# Altium schematic sheet [01] - COVER PAGE.SchDoc
size A; SheetNumber: 2; SheetTotal: 4
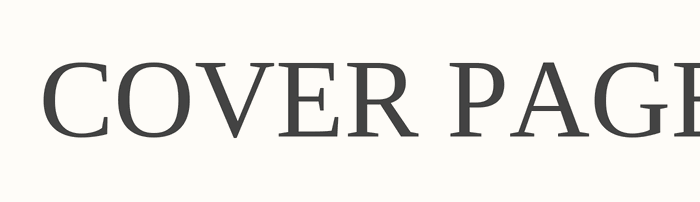
[diagram p0: [01] - COVER PAGE.SchDoc]

## Notes on the sheet
- COVER PAGE